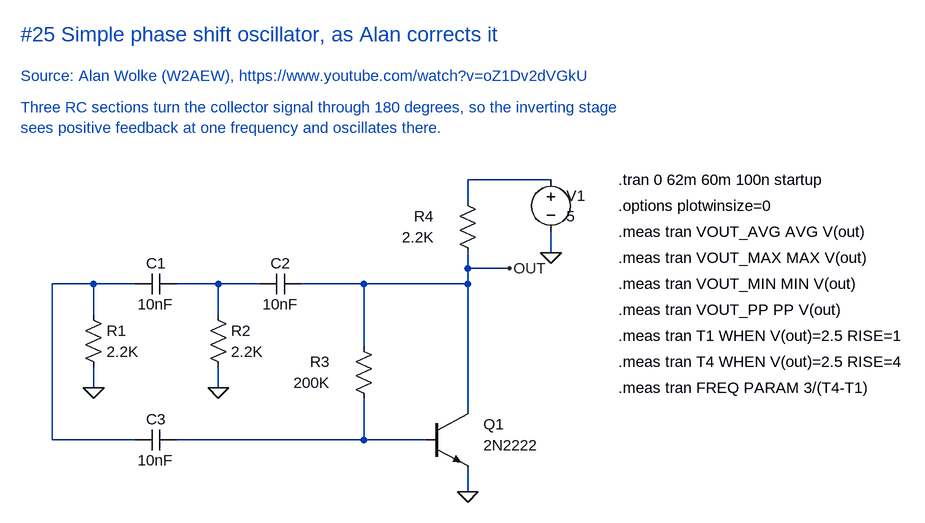
[diagram p0: schematic Phase shift oscillator.asc]
Phase shift oscillator.asc, the LTspice schematic file:
Version 4
SHEET 1 2000 1100
WIRE 976 224 848 224
WIRE 848 224 848 256
WIRE 848 336 848 360
WIRE 848 360 848 384
WIRE 848 360 912 360
WIRE 976 304 976 336
WIRE 208 384 272 384
WIRE 272 384 336 384
WIRE 400 384 464 384
WIRE 464 384 528 384
WIRE 592 384 688 384
WIRE 688 384 848 384
WIRE 272 384 272 432
WIRE 272 512 272 544
WIRE 464 384 464 432
WIRE 464 512 464 544
WIRE 208 384 208 624
WIRE 208 624 336 624
WIRE 400 624 688 624
WIRE 688 624 784 624
WIRE 688 384 688 480
WIRE 688 560 688 624
WIRE 848 384 848 576
WIRE 848 672 848 704
FLAG 976 336 0
FLAG 272 544 0
FLAG 464 544 0
FLAG 848 704 0
FLAG 912 360 OUT
SYMBOL voltage 976 208 R0
WINDOW 0 24 40 Left 2
WINDOW 3 24 72 Left 2
SYMATTR InstName V1
SYMATTR Value 5
SYMBOL res 832 240 R0
WINDOW 0 -36 40 Right 2
WINDOW 3 -36 72 Right 2
SYMATTR InstName R4
SYMATTR Value 2.2K
SYMBOL cap 400 368 R90
WINDOW 0 0 32 VBottom 2
WINDOW 3 32 32 VTop 2
SYMATTR InstName C1
SYMATTR Value 10nF
SYMBOL cap 592 368 R90
WINDOW 0 0 32 VBottom 2
WINDOW 3 32 32 VTop 2
SYMATTR InstName C2
SYMATTR Value 10nF
SYMBOL cap 400 608 R90
WINDOW 0 0 32 VBottom 2
WINDOW 3 32 32 VTop 2
SYMATTR InstName C3
SYMATTR Value 10nF
SYMBOL res 256 416 R0
WINDOW 0 36 40 Left 2
WINDOW 3 36 72 Left 2
SYMATTR InstName R1
SYMATTR Value 2.2K
SYMBOL res 448 416 R0
WINDOW 0 36 40 Left 2
WINDOW 3 36 72 Left 2
SYMATTR InstName R2
SYMATTR Value 2.2K
SYMBOL res 672 464 R0
WINDOW 0 -36 40 Right 2
WINDOW 3 -36 72 Right 2
SYMATTR InstName R3
SYMATTR Value 200K
SYMBOL npn 784 576 R0
WINDOW 0 88 24 Left 2
WINDOW 3 88 56 Left 2
SYMATTR InstName Q1
SYMATTR Value 2N2222
TEXT 160 0 Left 3 ;#25 Simple phase shift oscillator, as Alan corrects it
TEXT 160 64 Left 2 ;Source: Alan Wolke (W2AEW), https://www.youtube.com/watch?v=oZ1Dv2dVGkU
TEXT 160 112 Left 2 ;Three RC sections turn the collector signal through 180 degrees, so the inverting stage
TEXT 160 144 Left 2 ;sees positive feedback at one frequency and oscillates there.
TEXT 1080 224 Left 2 !.tran 0 62m 60m 100n startup
TEXT 1080 264 Left 2 !.options plotwinsize=0
TEXT 1080 304 Left 2 !.meas tran VOUT_AVG AVG V(out)
TEXT 1080 344 Left 2 !.meas tran VOUT_MAX MAX V(out)
TEXT 1080 384 Left 2 !.meas tran VOUT_MIN MIN V(out)
TEXT 1080 424 Left 2 !.meas tran VOUT_PP PP V(out)
TEXT 1080 464 Left 2 !.meas tran T1 WHEN V(out)=2.5 RISE=1
TEXT 1080 504 Left 2 !.meas tran T4 WHEN V(out)=2.5 RISE=4
TEXT 1080 544 Left 2 !.meas tran FREQ PARAM 3/(T4-T1)

The netlist it stands for:
* Phase shift oscillator.asc
V1 N001 0 5
R4 N001 OUT 2.2K
C1 N003 N002 10nF
C2 OUT N003 10nF
C3 N004 N002 10nF
R1 N002 0 2.2K
R2 N003 0 2.2K
R3 OUT N004 200K
Q1 OUT N004 0 0 2N2222
.model NPN NPN
.model PNP PNP
.lib standard.bjt
* #25 Simple phase shift oscillator, as Alan corrects it
* Source: Alan Wolke (W2AEW), https://www.youtube.com/watch?v=oZ1Dv2dVGkU
* Three RC sections turn the collector signal through 180 degrees, so the inverting stage
* sees positive feedback at one frequency and oscillates there.
.tran 0 62m 60m 100n startup
.options plotwinsize=0
.meas tran VOUT_AVG AVG V(out)
.meas tran VOUT_MAX MAX V(out)
.meas tran VOUT_MIN MIN V(out)
.meas tran VOUT_PP PP V(out)
.meas tran T1 WHEN V(out)=2.5 RISE=1
.meas tran T4 WHEN V(out)=2.5 RISE=4
.meas tran FREQ PARAM 3/(T4-T1)
.backanno
.end